# Altium schematic sheet ESC_Header.SchDoc
size A
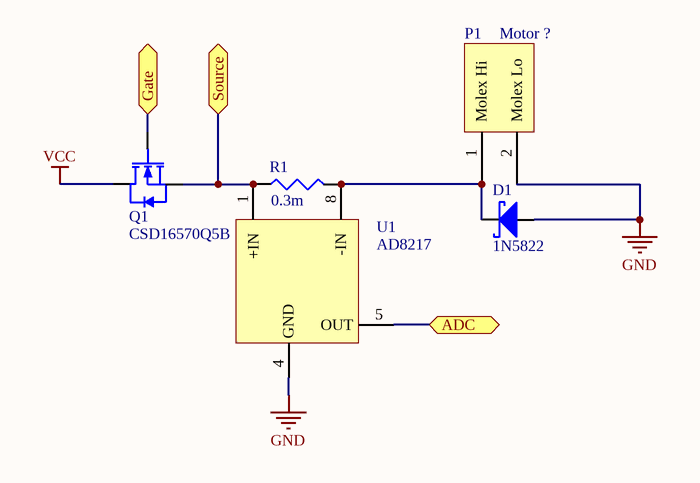
[diagram p0: ESC_Header.SchDoc]

## Parts
D1  1N5822  [1N58xx]
P1  Motor ?  [76829-0102]
Q1  CSD16570Q5B  [CSD16570Q5B]
R1  value 0.3m  [HSC2512xxxL300]  (hidden comment: HCS2512)
U1  AD8217  [AD8217]

## Ports
ADC, Gate, Source

## Nets
GND: D1.A(Anode) P1.2(Molex_Lo) U1.4(GND)
VCC: Q1.D(Drain)
ADC: U1.5(OUT) ; port ADC
Gate: Q1.G(Gate) ; port Gate
Source: Q1.S(Source) R1.1 U1.1(+IN) ; port Source
NetD1_K: D1.K(Cathode) P1.1(Molex_Hi) R1.2 U1.8(-IN)

## Library data of the parts
D1 = 1N58xx: 1A Schottky Barrier Rectifier Diode; Datasheet: http://www.kesenes.com/pdf/1n5817-1n5819.pdf
P1 = Megafit Slim Vert 2 Peg: mfgr_part_num: 76829-0102
Q1 = CSD16570Q5B: MOSFET N-CH 25V 100A 8VSON; Manufacturer: Texas Instruments; Packing: Reel; QG: 250 nC; RDS (on) (max): 0.59 mOhm; VGS(th) (max): 1.9 V; VGS (max): 20 V; Supplier 1: Digikey; Supplier Part Number 1: 296-47753-1-ND; ID (max): 100 A; VDS (max): 25 V; Mounting Technology: Surface Mount; PartNumber: CSD16570Q5B; ComponentLink1Description: Manufacturer URL; ComponentLink1URL: http://www.ti.com/; ComponentLink2Description: Datasheet; ComponentLink2URL: http://www.ti.com/lit/ds/symlink/csd16570q5b.pdf; Digikey Link: https://www.digikey.com/product-detail/en/texas-instruments/CSD16570Q5B/296-47753-1-ND/8133102
R1 = HCS2512FTL300: 300 µOhms ±1% 3W Chip Resistor 2512 (6432 Metric) Automotive AEC-Q200, Current Sense, Moisture Resistant Metal Foil; Digikey: https://www.digikey.com/product-detail/en/stackpole-electronics-inc/HCS2512FTL300/HCS2512FTL300CT-ND/4517526; Datasheet: https://www.seielect.com/catalog/sei-hcs.pdf
U1 = AD8217: High Resolution, Zero-Drift  Current Shunt Monitor; Datasheet: https://www.analog.com/media/en/technical-documentation/data-sheets/AD8217.pdf